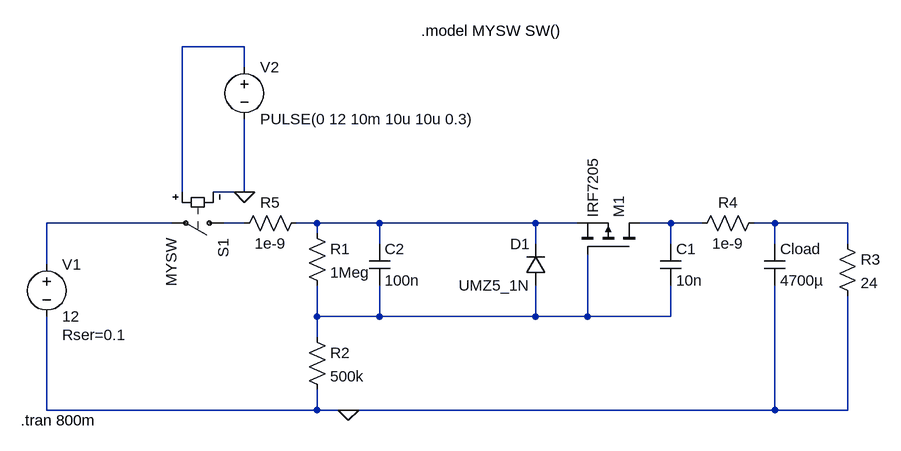
[diagram p0: schematic soft_start (ramp rate control).asc]
soft_start (ramp rate control).asc, the LTspice schematic file:
Version 4.1
SHEET 1 1668 680
WIRE 224 -240 128 -240
WIRE 224 -208 224 -240
WIRE 128 -16 128 -240
WIRE 224 -16 224 -128
WIRE 224 -16 176 -16
WIRE 112 32 -80 32
WIRE 224 32 192 32
WIRE 336 32 304 32
WIRE 432 32 336 32
WIRE 672 32 432 32
WIRE 736 32 672 32
WIRE 880 32 832 32
WIRE 928 32 880 32
WIRE 1040 32 1008 32
WIRE 1152 32 1040 32
WIRE 336 48 336 32
WIRE 432 64 432 32
WIRE 672 64 672 32
WIRE 880 64 880 32
WIRE 1040 64 1040 32
WIRE 1152 64 1152 32
WIRE -80 96 -80 32
WIRE 336 176 336 128
WIRE 432 176 432 128
WIRE 432 176 336 176
WIRE 672 176 672 128
WIRE 672 176 432 176
WIRE 752 176 752 80
WIRE 752 176 672 176
WIRE 880 176 880 128
WIRE 880 176 752 176
WIRE 336 208 336 176
WIRE -80 320 -80 176
WIRE 336 320 336 288
WIRE 336 320 -80 320
WIRE 384 320 336 320
WIRE 1040 320 1040 128
WIRE 1040 320 384 320
WIRE 1152 320 1152 144
WIRE 1152 320 1040 320
FLAG 384 320 0
FLAG 224 -16 0
SYMBOL voltage -80 80 R0
WINDOW 123 0 0 Left 0
WINDOW 39 24 124 Left 2
SYMATTR SpiceLine Rser=0.1
SYMATTR InstName V1
SYMATTR Value 12
SYMBOL res 320 32 R0
SYMATTR InstName R1
SYMATTR Value 1Meg
SYMBOL res 320 192 R0
SYMATTR InstName R2
SYMATTR Value 500k
SYMBOL cap 864 64 R0
SYMATTR InstName C1
SYMATTR Value 10n
SYMATTR SpiceLine Rser=1
SYMBOL pmos 832 80 M270
SYMATTR InstName M1
SYMATTR Value IRF7205
SYMBOL cap 416 64 R0
SYMATTR InstName C2
SYMATTR Value 100n
SYMATTR SpiceLine Rser=1
SYMBOL cap 1024 64 R0
SYMATTR Value 4700µ
SYMATTR InstName Cload
SYMATTR SpiceLine V=16 Irms=1.56 Rser=0.045 Lser=0 mfg="Nichicon" pn="UPR1C472MRH" type="Al electrolytic"
SYMBOL res 1136 48 R0
SYMATTR InstName R3
SYMATTR Value 24
SYMBOL sw 208 32 R90
SYMATTR InstName S1
SYMATTR Value MYSW
SYMBOL voltage 224 -224 R0
WINDOW 123 0 0 Left 0
WINDOW 39 0 0 Left 0
SYMATTR InstName V2
SYMATTR Value PULSE(0 12 10m 10u 10u 0.3)
SYMBOL res 912 48 R270
WINDOW 0 32 56 VTop 2
WINDOW 3 0 56 VBottom 2
SYMATTR InstName R4
SYMATTR Value 1e-9
SYMBOL res 208 48 R270
WINDOW 0 32 56 VTop 2
WINDOW 3 0 56 VBottom 2
SYMATTR InstName R5
SYMATTR Value 1e-9
SYMBOL diode 688 128 R180
WINDOW 0 24 64 Left 2
WINDOW 3 24 0 Left 2
SYMATTR InstName D1
SYMATTR Value UMZ5_1N
TEXT -120 336 Left 2 !.tran 800m
TEXT 496 -264 Left 2 !.model MYSW SW()

The netlist it stands for:
* soft_start (ramp rate control).asc
V1 N002 0 12 Rser=0.1
R1 N004 N007 1Meg
R2 N007 0 500k
C1 N005 N007 10n Rser=1
M1 N005 N007 N004 N004 IRF7205
C2 N004 N007 100n Rser=1
Cload N006 0 4700µ V=16 Irms=1.56 Rser=0.045 Lser=0 mfg="Nichicon" pn="UPR1C472MRH" type="Al electrolytic"
R3 N006 0 24
S1 N003 N002 N001 0 MYSW
V2 N001 0 PULSE(0 12 10m 10u 10u 0.3)
R4 N005 N006 1e-9
R5 N003 N004 1e-9
D1 N007 N004 UMZ5_1N
.model D D
.lib standard.dio
.model NMOS NMOS
.model PMOS PMOS
.lib standard.mos
.tran 800m
.model MYSW SW()
.backanno
.end